# EasyEDA Pro project PROJETO EPTA.epro

# Schematic Schematic1
Board Name: Board1; Create Date: 2026-10-14; Page Name: P1; Project Name: PROJETO EPTA; Schematic Name: Schematic1; Update Date: 2026-10-14; Company: EasyEDA.com; Page Size: A4; Version: V1.0
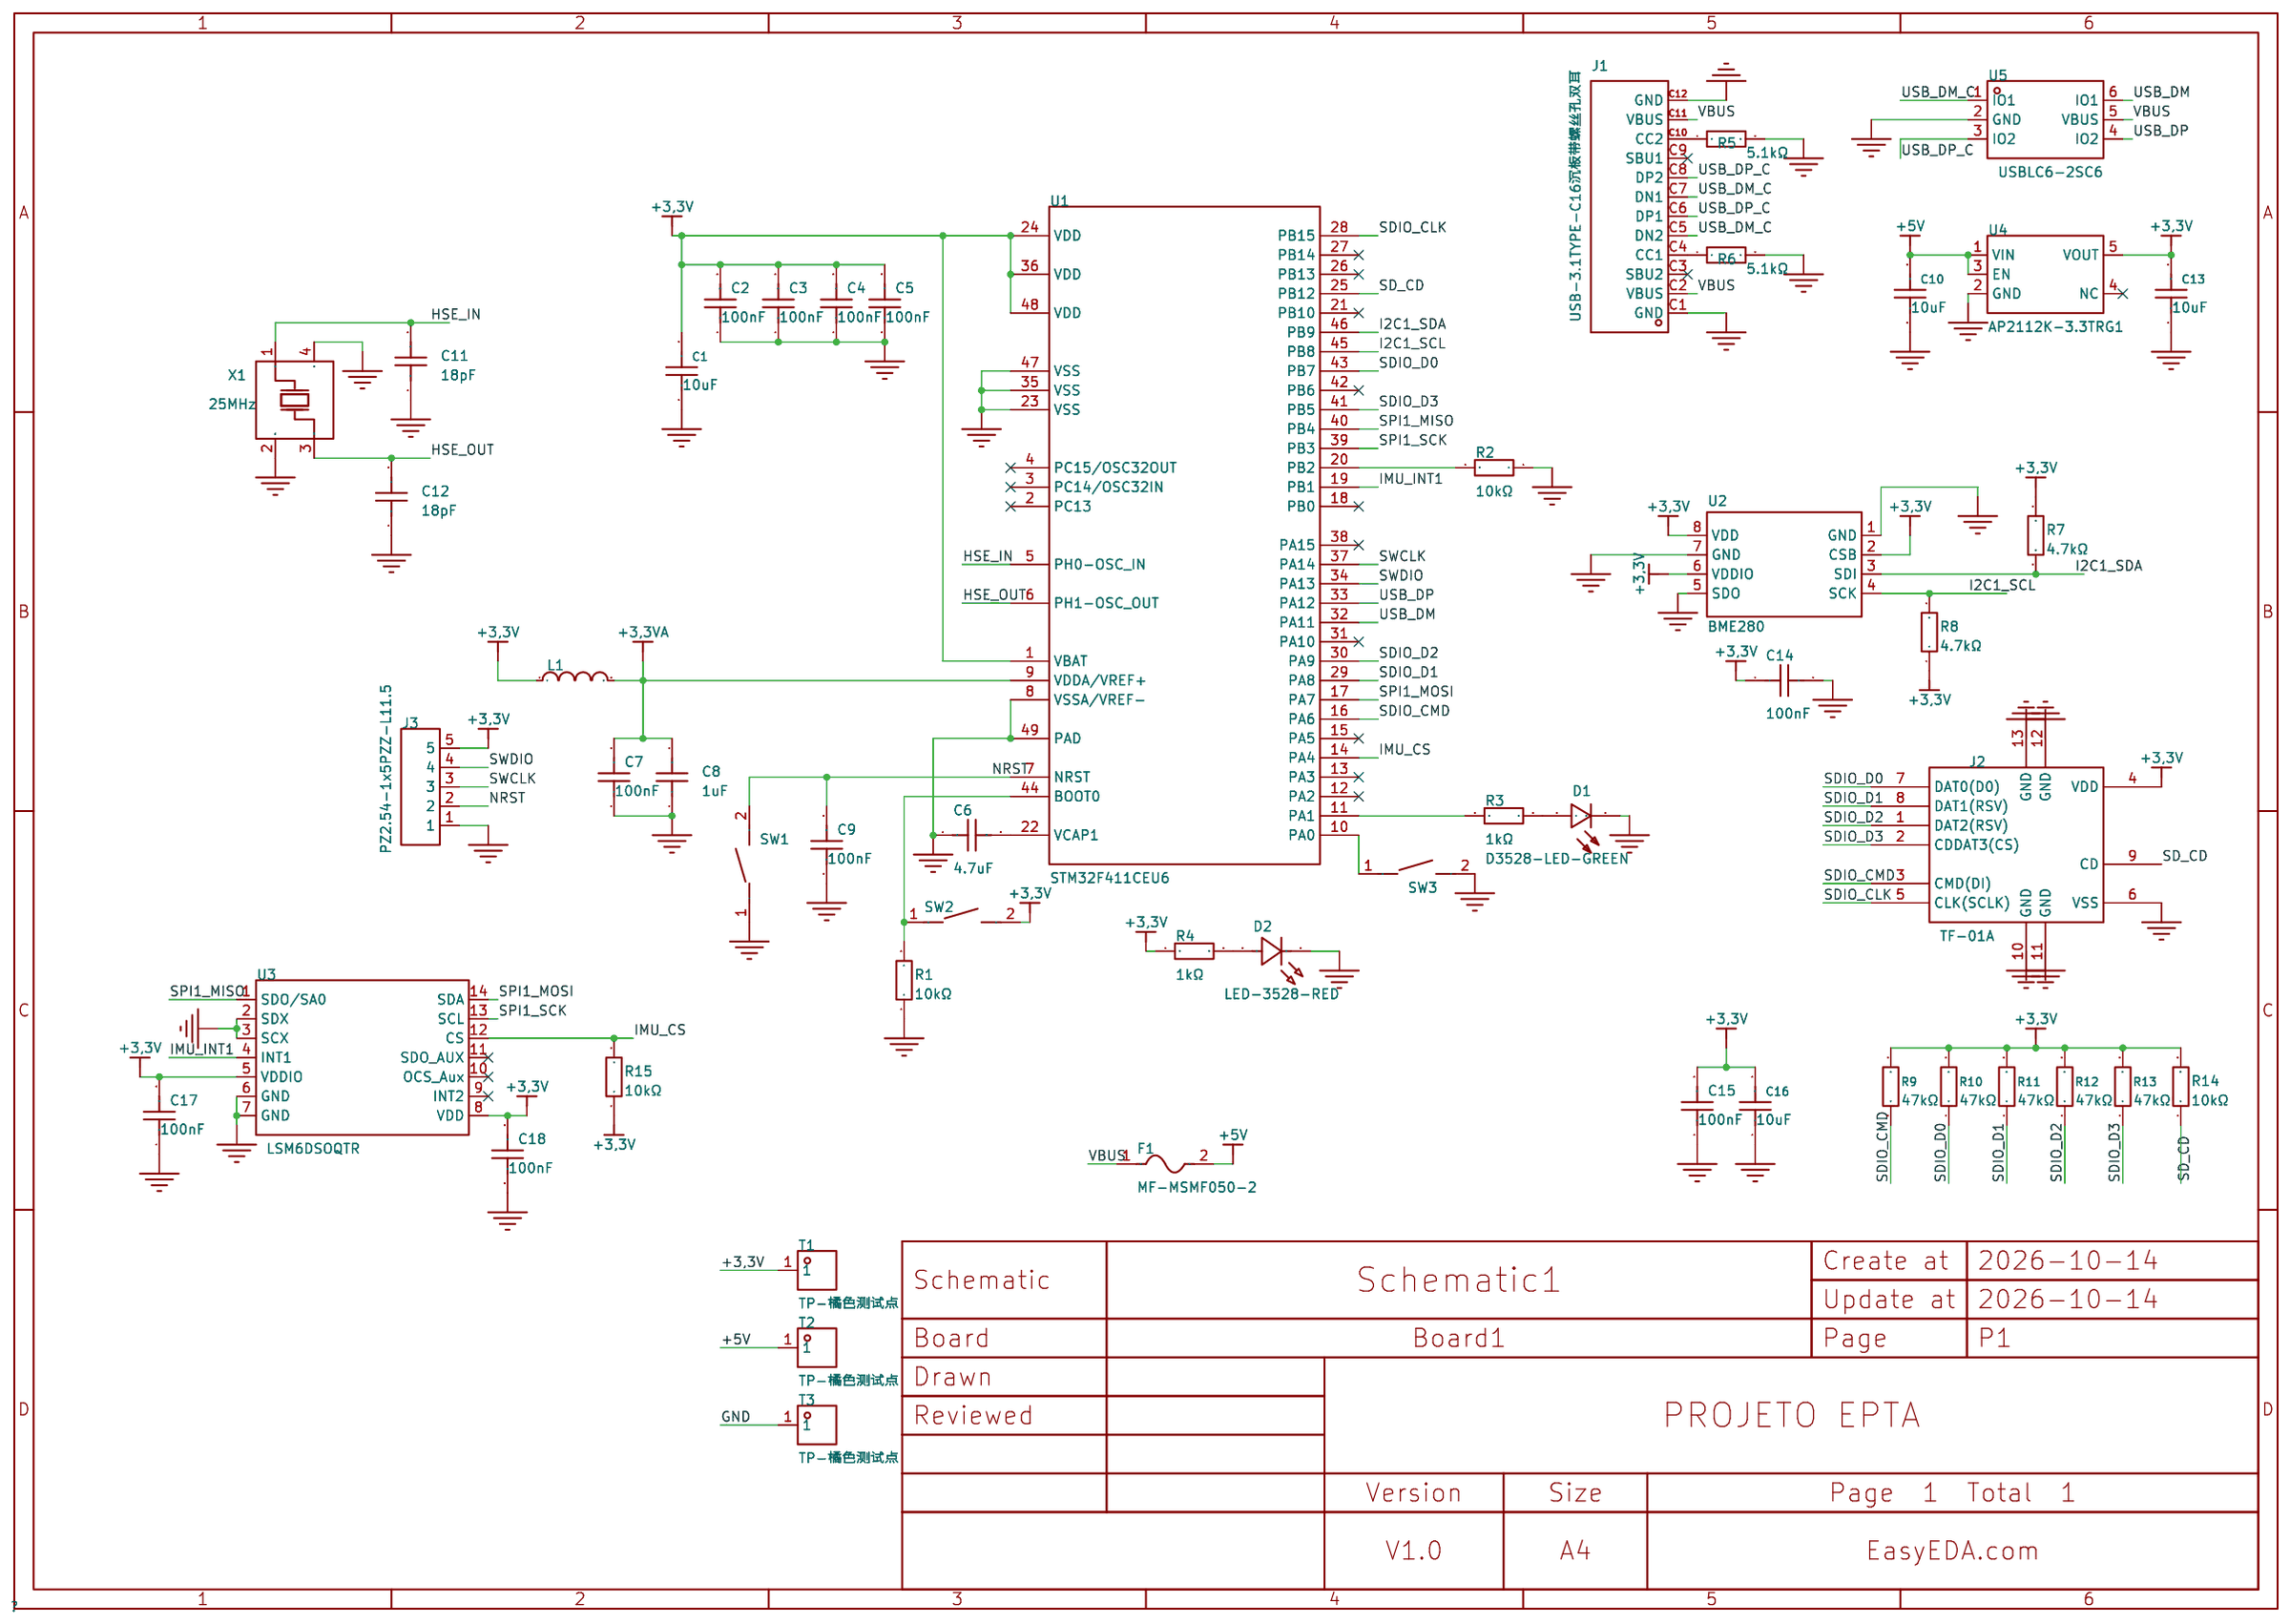
[diagram p0: schematic sheet]

## Parts
C1  10uF  [C0603]
C2  100nF  [C0201]
C3  100nF  [C0201]
C4  100nF  [C0201]
C5  100nF  [C0201]
C6  4.7uF  [C0603]
C7  100nF  [C0201]
C8  1uF  [C0603]
C9  100nF  [C0201]
C10  10uF  [C0603]
C11  18pF  [C0201]
C12  18pF  [C0201]
C13  10uF  [C0603]
C14  100nF  [C0201]
C15  100nF  [C0201]
C16  10uF  [C0603]
C17  100nF  [C0201]
C18  100nF  [C0201]
D1  D3528-LED-GREEN  [LED-SMD_L3.5-W2.8-RD_GREEN]
D2  LED-3528-RED  [LED-SMD_L3.5-W2.8-FD_RED]
F1  MF-MSMF050-2  [F1812]
J1  USB-3.1TYPE-C16沉板带螺丝孔双耳  [USB-C-SMD_USB-3.1TYPE-C16]
J2  TF-01A  [TF-SMD_TF-01A]
J3  PZ2.54-1x5PZZ-L11.5  [HDR-TH_PZ2.54-1X5PZZ-L11.5]
L1  BEAD0402A102A02T  [L0402]
R1  10kΩ  [R0603]
R2  10kΩ  [R0603]
R3  1kΩ  [R0603]
R4  1kΩ  [R0603]
R5  5.1kΩ  [R0603]
R6  5.1kΩ  [R0603]
R7  4.7kΩ  [R0603]
R8  4.7kΩ  [R0603]
R9  47kΩ  [R0603]
R10  47kΩ  [R0603]
R11  47kΩ  [R0603]
R12  47kΩ  [R0603]
R13  47kΩ  [R0603]
R14  10kΩ  [R0603]
R15  10kΩ  [R0603]
SW1  TS-1088-AR02016  [SW-SMD_L3.9-W3.0-P4.45]
SW2  TS-1088-AR02016  [SW-SMD_L3.9-W3.0-P4.45]
SW3  TS-1088-AR02016  [SW-SMD_L3.9-W3.0-P4.45]
T1  TP-橘色测试点  [TESTPOINT-TH_BD3.2]
T2  TP-橘色测试点  [TESTPOINT-TH_BD3.2]
T3  TP-橘色测试点  [TESTPOINT-TH_BD3.2]
U1  STM32F411CEU6  [UFQFPN-48_L7.0-W7.0-P0.50-BL-EP]
U2  BME280  [LGA-8_BME280_BL]
U3  LSM6DSOQTR  [LGA-14_L3.0-W2.5-P0.50-BL]
U4  AP2112K-3.3TRG1  [SOT-23-5_L2.9-W1.6-P0.95-LS2.8-BR]
U5  USBLC6-2SC6  [SOT-23-6_L2.9-W1.6-P0.95-LS2.8-BL]
X1  25MHz  [CRYSTAL-SMD_4P-L3.2-W2.5-BL]

## Library data of the parts
C1 C10 C13 C16 = CL10A106MA8NRNC: Capacitance:10uF Tolerance:±20% Tolerance:±20% Voltage Rating:25V Temperature Coefficient:X5R; LCSC Part Name: 10uF ±20% 25V; Supplier Part: C96446; Manufacturer: SAMSUNG(三星); Supplier Footprint: 0603; JLCPCB Part Class: Basic Part; Datasheet: https://item.szlcsc.com/datasheet/CL10A106MA8NRNC/97651.html; Supplier: LCSC; Tolerance: ±20%; Voltage Rating: 25V; Temperature Coefficient: X5R
C2-C5 C7 C9 C14 C15 C17 C18 = C0603X5R1E104KT00NN: Capacitance:100nF Tolerance:±10% Tolerance:±10% Voltage Rating:25V Temperature Coefficient:X5R; LCSC Part Name: 100nF ±10% 25V; Supplier Part: C694146; Manufacturer: TDK; Supplier Footprint: 0201; JLCPCB Part Class: Extended Part; Datasheet: https://atta.szlcsc.com/upload/public/pdf/source/20191008/C432930_1569A900251E35B50161EFC1E9A1C511.pdf; Supplier: LCSC; Tolerance: ±10%; Voltage Rating: 25V; Temperature Coefficient: X5R
C6 = CL10A475KO8NNNC: Capacitance:4.7uF Tolerance:±10% Tolerance:±10% Voltage Rating:16V Temperature Coefficient:X5R; LCSC Part Name: 4.7uF ±10% 16V; Supplier Part: C19666; Manufacturer: SAMSUNG(三星); Supplier Footprint: 0603; JLCPCB Part Class: Basic Part; Datasheet: https://item.szlcsc.com/datasheet/CL10A475KO8NNNC/20375.html; Supplier: LCSC; Tolerance: ±10%; Voltage Rating: 16V; Temperature Coefficient: X5R
C8 = CL10A105KB8NNNC: Capacitance:1uF Tolerance:±10% Tolerance:±10% Voltage Rating:50V Temperature Coefficient:X5R; LCSC Part Name: 1uF ±10% 50V; Supplier Part: C15849; Manufacturer: SAMSUNG(三星); Supplier Footprint: 0603; JLCPCB Part Class: Basic Part; Datasheet: https://item.szlcsc.com/datasheet/CL10A105KB8NNNC/16531.html; Supplier: LCSC; Tolerance: ±10%; Voltage Rating: 50V; Temperature Coefficient: X5R
C11 C12 = V180K0201C0G500NAT: Capacitance:18pF Tolerance:±10% Tolerance:±10% Voltage Rating:50V Temperature Coefficient:C0G; LCSC Part Name: 18pF ±10% 50V; Supplier Part: C525071; Manufacturer: VIIYONG(微容); Supplier Footprint: 0201; JLCPCB Part Class: Extended Part; Datasheet: https://atta.szlcsc.com/upload/public/pdf/source/20200508/C525085_CA83688404A026D90E3292C67F2EEEA3.pdf; Supplier: LCSC; Tolerance: ±10%; Voltage Rating: 50V; Temperature Coefficient: C0G
D1 = D3528-LED-GREEN: Supplier Part: C9900001516; Supplier Footprint: LED-GREEN; JLCPCB Part Class: Extended Part; Supplier: LCSC
D2 = LED-3528-RED: Supplier Part: C9900020242; JLCPCB Part Class: Extended Part; Supplier: LCSC
F1 = MF-MSMF050-2: Voltage - Max:15V Current - Max:100A Hold Current:500mA Trip Current:1A Power Dissipation:800mW Resistance - Initial (Ri) (Min):150mΩ Resistance - Post Trip (R1) (Max):1Ω Time to Trip(Max):150ms Operating Temperature:-40℃~+85℃ Operating Temperature:-40℃~+; LCSC Part Name: 15V 500mA 1812自恢复; Supplier Part: C17313; Manufacturer: BOURNS; Supplier Footprint: 1812; JLCPCB Part Class: Extended Part; Datasheet: https://item.szlcsc.com/datasheet/MF-MSMF050-2/17998.html; Supplier: LCSC; Voltage - Max: 15V; Current - Max: 100A; Hold Current: 500mA; Trip Current: 1A; Power Dissipation: 800mW; Resistance - Initial (Ri) (Min): 150mΩ; Resistance - Post Trip (R1) (Max): 1Ω; Time to Trip(Max): 150ms; Operating Temperature: -40℃~+85℃; Length: 5.4mm; Width: 3.2mm; Height: 0.85mm
J1 = USB-3.1TYPE-C16沉板带螺丝孔双耳: Supplier Part: C9900026744; Supplier Footprint: USB-C-16P; JLCPCB Part Class: Extended Part; Supplier: LCSC
J2 = TF-01A: Supplier Part: C9900015511; Supplier Footprint: tf-smd; JLCPCB Part Class: Extended Part; Supplier: LCSC
J3 = PZ2.54-1x5PZZ-L11.5: Pin Structure:1x5P Pitch:2.54mm Row Spacing:- Circluar Pins/Square Pins:Pin Header Mounting Type:Through Hole Number of Rows:1 Number of Pins:5P Current Rating:3A Voltage Rating (Max):250V Length of Mating Pin:6mm Insulation Height:2.5mm Length of End Con; LCSC Part Name: 1x5P 间距:2.54mm 方针 直插; Supplier Part: C54876670; Manufacturer: SHOU HAN(首韩); Supplier Footprint: 插件,P=2.54mm; JLCPCB Part Class: Extended Part; Datasheet: https://item.szlcsc.com/datasheet/PZ2.54-1x5PZZ-L11.5/58389785.html; Supplier: LCSC; Pin Structure: 1x5P; Pitch: 2.54mm; Circluar Pins/Square Pins: Pin Header; Mounting Type: Through Hole; Number of Rows: 1; Number of Pins: 5P; Current Rating: 3A; Voltage Rating (Max): 250V; Length of Mating Pin: 6mm; Insulation Height: 2.5mm; Length of End Connection Pin: 3mm; Contact Material: Brass; Contact Plating: Gold; Operating Temperature: -40℃~+105℃; Color: Black
L1 = BEAD0402A102A02T: Supplier Part: C9900021104; JLCPCB Part Class: Extended Part; Supplier: LCSC
R1 R2 R14 R15 = 0603WAF1002T5E: Type:Thick Film Resistor Resistance:10kΩ Tolerance:±1% Tolerance:±1% Power(Watts):100mW Voltage-Supply(Max):75V Temperature Coefficient:±100ppm/℃ Temperature Coefficient:±100ppm/℃ Operating Temperature:-55℃~+155℃ Operating Temperature:-55℃~+155℃; LCSC Part Name: 厚膜电阻 10kΩ ±1% 100mW; Supplier Part: C25804; Manufacturer: UNI-ROYAL(厚声); Supplier Footprint: 0603; JLCPCB Part Class: Basic Part; Datasheet: https://item.szlcsc.com/datasheet/0603WAF1002T5E/26547.html; Supplier: LCSC; Type: Thick Film Resistor; Tolerance: ±1%; Power(Watts): 100mW; Voltage-Supply(Max): 75V; Temperature Coefficient: ±100ppm/℃; Operating Temperature: -55℃~+155℃
R3 R4 = 0603WAF1001T5E: Type:Thick Film Resistor Resistance:1kΩ Tolerance:±1% Tolerance:±1% Power(Watts):100mW Voltage-Supply(Max):75V Temperature Coefficient:±100ppm/℃ Temperature Coefficient:±100ppm/℃ Operating Temperature:-55℃~+155℃ Operating Temperature:-55℃~+155℃; LCSC Part Name: 1kΩ ±1% 100mW 厚膜电阻; Supplier Part: C21190; Manufacturer: UNI-ROYAL(厚声); Supplier Footprint: 0603; JLCPCB Part Class: Basic Part; Datasheet: https://item.szlcsc.com/datasheet/0603WAF1001T5E/21904.html; Supplier: LCSC; Type: Thick Film Resistor; Tolerance: ±1%; Power(Watts): 100mW; Voltage-Supply(Max): 75V; Temperature Coefficient: ±100ppm/℃; Operating Temperature: -55℃~+155℃
R5 R6 = 0603WAF5101T5E: Type:Thick Film Resistor Resistance:5.1kΩ Tolerance:±1% Tolerance:±1% Power(Watts):100mW Voltage-Supply(Max):75V Temperature Coefficient:±100ppm/℃ Temperature Coefficient:±100ppm/℃ Operating Temperature:-55℃~+155℃ Operating Temperature:-55℃~+155℃; LCSC Part Name: 厚膜电阻 5.1kΩ ±1%; Supplier Part: C23186; Manufacturer: UNI-ROYAL(厚声); Supplier Footprint: 0603; JLCPCB Part Class: Basic Part; Datasheet: https://item.szlcsc.com/datasheet/0603WAF5101T5E/23913.html; Supplier: LCSC; Type: Thick Film Resistor; Tolerance: ±1%; Power(Watts): 100mW; Voltage-Supply(Max): 75V; Temperature Coefficient: ±100ppm/℃; Operating Temperature: -55℃~+155℃
R7 R8 = 0603WAF4701T5E: Type:Thick Film Resistor Resistance:4.7kΩ Tolerance:±1% Tolerance:±1% Power(Watts):100mW Voltage-Supply(Max):75V Temperature Coefficient:±100ppm/℃ Temperature Coefficient:±100ppm/℃ Operating Temperature:-55℃~+155℃ Operating Temperature:-55℃~+155℃; LCSC Part Name: 厚膜电阻 4.7kΩ ±1%; Supplier Part: C23162; Manufacturer: UNI-ROYAL(厚声); Supplier Footprint: 0603; JLCPCB Part Class: Basic Part; Datasheet: https://item.szlcsc.com/datasheet/0603WAF4701T5E/23889.html; Supplier: LCSC; Type: Thick Film Resistor; Tolerance: ±1%; Power(Watts): 100mW; Voltage-Supply(Max): 75V; Temperature Coefficient: ±100ppm/℃; Operating Temperature: -55℃~+155℃
R9-R13 = 0603WAF4702T5E: Type:Thick Film Resistor Resistance:47kΩ Tolerance:±1% Tolerance:±1% Power(Watts):100mW Voltage-Supply(Max):75V Temperature Coefficient:±100ppm/℃ Temperature Coefficient:±100ppm/℃ Operating Temperature:-55℃~+155℃ Operating Temperature:-55℃~+155℃; LCSC Part Name: 厚膜电阻 47kΩ ±1%; Supplier Part: C25819; Manufacturer: UNI-ROYAL(厚声); Supplier Footprint: 0603; JLCPCB Part Class: Basic Part; Datasheet: https://item.szlcsc.com/datasheet/0603WAF4702T5E/26562.html; Supplier: LCSC; Type: Thick Film Resistor; Tolerance: ±1%; Power(Watts): 100mW; Voltage-Supply(Max): 75V; Temperature Coefficient: ±100ppm/℃; Operating Temperature: -55℃~+155℃
SW1-SW3 = TS-1088-AR02016: Circuit:SPST Actuator Style:Round Button Operating Force:1.6N Mounting Type:Surface Mount,Vertical Length:3.9mm Width:3mm Switch Height:2mm with Bracket:Without Bracket Contact Current:50mA Voltage Rating:12V Actuator/Cap Color:Black With Lamp:- IP Rating; LCSC Part Name: 3.9*3*2mm 立贴 轻触开关; Supplier Part: C720477; Manufacturer: XUNPU(讯普); Supplier Footprint: SMD,4x3mm; JLCPCB Part Class: Basic Part; Datasheet: https://item.szlcsc.com/datasheet/TS-1088-AR02016/763484.html; Supplier: LCSC; Circuit: SPST; Actuator Style: Round Button; Operating Force: 1.6N; Mounting Type: Surface Mount,Vertical; Length: 3.9mm; Width: 3mm; Switch Height: 2mm; with Bracket: Without Bracket; Contact Current: 50mA; Voltage Rating: 12V; Actuator/Cap Color: Black; Termination Style: SMD(SMT) Tab; Life: 100,000 cycles; Operating Temperature: -30℃~+80℃
T1-T3 = TP-橘色测试点: Supplier Part: C9900007421; Supplier Footprint: TESTPOINT-TH_BD-2P-P2.00; JLCPCB Part Class: Extended Part; Supplier: LCSC
U1 = STM32F411CEU6: CPU Core:ARM Cortex-M4 CPU Maximum Speed:100MHz Core Size:32 Bit Program Storage Size:512KB Program Memory Type:FLASH RAM Size:128KB EEPROM:- Number of I/O:36 ADC (Bit):12bit Oscillator Type:Built-in Voltage - Supply:1.7V~3.6V Voltage - Supply:1.7V~3.6V O; LCSC Part Name: 带DSP和FPU的高性能基本型系列ARM Cortex-M4 MCU，具有512 KB Flash、100 MHz CPU和ART加速器; Supplier Part: C60420; Manufacturer: ST(意法半导体); Supplier Footprint: UFQFPN-48(7x7); JLCPCB Part Class: Extended Part; Datasheet: https://item.szlcsc.com/datasheet/STM32F411CEU6/61472.html; Supplier: LCSC; CPU Core: ARM Cortex-M4; CPU Maximum Speed: 100MHz; Core Size: 32 Bit; Program Storage Size: 512KB; Program Memory Type: FLASH; RAM Size: 128KB; Number of I/O: 36; ADC (Bit): 12bit; Oscillator Type: Built-in; Voltage - Supply: 1.7V~3.6V; Operating Temperature: -40℃~+85℃
U2 = BME280: Temperature Range:-40℃~+85℃ Temperature Range:-40℃~+85℃ Humidity:0%RH~100%RH Humidity:0%RH~100%RH Interface:I2C；SPI Voltage - Supply:1.71V~3.6V Voltage - Supply:1.71V~3.6V Current - Supply:1.8uA Humidity Tolerance:±3%RH Humidity Tolerance:±3%RH Temperatur; LCSC Part Name: 湿度：0%RH~100%RH; Supplier Part: C92489; Manufacturer: Bosch(博世); Supplier Footprint: LGA-8(2.5x2.5); JLCPCB Part Class: Extended Part; Datasheet: https://item.szlcsc.com/datasheet/BME280/93682.html; Supplier: LCSC; Temperature Range: -40℃~+85℃; Humidity: 0%RH~100%RH; Interface: I2C；SPI; Voltage - Supply: 1.71V~3.6V; Current - Supply: 1.8uA; Humidity Tolerance: ±3%RH; Temperature Tolerance: ±0.5℃; Resolution: 16bit; Features: Self-diagnosis and confidence flag；Temperature compensation；Factory calibration
U3 = LSM6DSOQTR: Accelerometer Sensing Axis:X,Y,Z Acceleration Measurement Range (MAX):±16g Acceleration Measurement Range (MAX):±16g Gyroscope Sensing Axis:X,Y,Z Gyroscope Measurement Range (MAX):±2000dps Gyroscope Measurement Range (MAX):±2000dps Sensor Type:IMU (accele; LCSC Part Name: 六轴惯性测量单元（IMU）：常开式三轴加速度计和三轴陀螺仪; Supplier Part: C6805512; Manufacturer: ST(意法半导体); Supplier Footprint: LGA-14L(2.5x3); JLCPCB Part Class: Extended Part; Datasheet: https://item.szlcsc.com/datasheet/LSM6DSOQTR/7766212.html; Supplier: LCSC; Accelerometer Sensing Axis: X,Y,Z; Acceleration Measurement Range (MAX): ±16g; Gyroscope Sensing Axis: X,Y,Z; Gyroscope Measurement Range (MAX): ±2000dps; Sensor Type: IMU (accelerometer + gyroscope); Interface: I2C；SPI; Voltage - Supply: 1.71V~3.6V; Cache Size: 9KB; Standby Current: 3uA; Operating Temperature: -40℃~+85℃; Features: Motion event detection
U4 = AP2112K-3.3TRG1_C23380830: Output Configuration:Positive Voltage - Supply:5.5V Output Voltage:3.3V Output Voltage:3.3V Output Current:600mA Power Supply Rejection Ratio (PSRR):75dB@(1kHz) Voltage Dropout:320mV@(600mA) standby current:10uA Noise:- Features:Enable control；Over Curren; LCSC Part Name: 3.3V 600mA 5.5V; Supplier Part: C23380830; Manufacturer: TECH PUBLIC(台舟); Supplier Footprint: SOT-23-5; JLCPCB Part Class: Extended Part; Datasheet: https://item.szlcsc.com/datasheet/AP2112K-3.3TRG1/25111500.html; Supplier: LCSC; Output Configuration: Positive; Voltage - Supply: 5.5V; Output Voltage: 3.3V; Output Current: 600mA; Power Supply Rejection Ratio (PSRR): 75dB@(1kHz); Voltage Dropout: 320mV@(600mA); standby current: 10uA; Features: Enable control；Over Current Protection；Output discharge；Thermal shutdown; Operating Temperature: -40℃~+85℃@(Ta); Output Type: Fixed; Number of Outputs: 1
U5 = USBLC6-2SC6_C2827654: Polarity:Unidirectional Reverse Stand-Off Voltage (Vrwm):5V Clamping Voltage:12V Peak Pulse Current (Ipp):6A Peak Pulse Power Dissipation (Ppp):150W Voltage - Breakdown:6V Reverse Leakage Current (Ir):80nA Number of Channels:2 Operating Temperature:-55℃~+; LCSC Part Name: 单向ESD 5V截止 峰值脉冲电流：6A; Supplier Part: C2827654; Manufacturer: TECH PUBLIC(台舟); Supplier Footprint: SOT-23-6; JLCPCB Part Class: Extended Part; Datasheet: https://item.szlcsc.com/datasheet/USBLC6-2SC6/2973336.html; Supplier: LCSC; Polarity: Unidirectional; Reverse Stand-Off Voltage (Vrwm): 5V; Clamping Voltage: 12V; Peak Pulse Current (Ipp): 6A; Peak Pulse Power Dissipation (Ppp): 150W; Voltage - Breakdown: 6V; Reverse Leakage Current (Ir): 80nA; Number of Channels: 2; Operating Temperature: -55℃~+125℃; level of protection: IEC 61000-4-2；IEC 61000-4-4；IEC 61000-4-5; Type: ESD; Junction Capacitance: 0.35pF
X1 = X322525MOB4SI: Type:Crystal Oscillator Frequency:25MHz Normal temperature Frequency Tolerance:±10ppm Normal temperature Frequency Tolerance:±10ppm Load Capacitance:12pF Frequency Stability:±20ppm Frequency Stability:±20ppm Equivalent Series Resistance(ESR):50Ω Operating; LCSC Part Name: YSX321SL 25MHZ 4P 3225 12PF ±10PPM -40~85℃ (±20PPM); Supplier Part: C9006; Manufacturer: YXC(扬兴晶振); Supplier Footprint: SMD3225-4P; JLCPCB Part Class: Basic Part; Datasheet: https://item.szlcsc.com/datasheet/X322525MOB4SI/9526.html; Supplier: LCSC; Type: Crystal Oscillator; Normal temperature Frequency Tolerance: ±10ppm; Load Capacitance: 12pF; Frequency Stability: ±20ppm; Equivalent Series Resistance(ESR): 50Ω; Operating Temperature: -40℃~+85℃

## Nets
+5V: C10.2 F1.2 T2.1 U4.1(VIN) U4.3(EN)
GND: C1.1 C2.1 C3.1 C4.1 C5.1 C6.1 C7.1 C8.1 C9.1 C10.1 C11.1 C12.1 C13.1 C14.2 C15.1 C16.1 C17.1 C18.1 D1.1(K) D2.1 J1.C1(GND) J1.C12(GND) J2.6(VSS) J2.10(GND) J2.11(GND) J2.12(GND) J2.13(GND) J3.1 R1.1 R2.1 R5.2 R6.2 SW1.1 SW3.2 T3.1 U1.8(VSSA/VREF-) U1.23(VSS) U1.35(VSS) U1.47(VSS) U1.49(PAD) U2.1(GND) U2.5(SDO) U2.7(GND) U3.2(SDX) U3.3(SCX) U3.6(GND) U3.7(GND) U4.2(GND) U5.2(GND) X1.2(GND) X1.4(GND)
VBUS: F1.1 J1.C2(VBUS) J1.C11(VBUS) U5.5(VBUS)
+3,3V: C1.2 C2.2 C3.2 C4.2 C5.2 C13.2 C14.1 C15.2 C16.2 C17.2 C18.2 J2.4(VDD) J3.5 L1.1 R4.1 R7.2 R8.1 R9.2 R10.2 R11.2 R12.2 R13.2 R14.2 R15.1 SW2.2 T1.1 U1.1(VBAT) U1.24(VDD) U1.36(VDD) U1.48(VDD) U2.2(CSB) U2.6(VDDIO) U2.8(VDD) U3.5(VDDIO) U3.8(VDD) U4.5(VOUT)
+3,3VA: C7.2 C8.2 L1.2 U1.9(VDDA/VREF+)
HSE_IN: C11.2 U1.5(PH0-OSC_IN) X1.1(OSC1)
HSE_OUT: C12.2 U1.6(PH1-OSC_OUT) X1.3(OSC2)
I2C1_SCL: R8.2 U1.45(PB8) U2.4(SCK)
I2C1_SDA: R7.1 U1.46(PB9) U2.3(SDI)
IMU_CS: R15.2 U1.14(PA4) U3.12(CS)
IMU_INT1: U1.19(PB1) U3.4(INT1)
NRST: C9.2 J3.2 SW1.2 U1.7(NRST)
SD_CD: J2.9(CD) R14.1 U1.25(PB12)
SDIO_CLK: J2.5(CLK(SCLK)) U1.28(PB15)
SDIO_CMD: J2.3(CMD(DI)) R9.1 U1.16(PA6)
SDIO_D0: J2.7(DAT0(D0)) R10.1 U1.43(PB7)
SDIO_D1: J2.8(DAT1(RSV)) R11.1 U1.29(PA8)
SDIO_D2: J2.1(DAT2(RSV)) R12.1 U1.30(PA9)
SDIO_D3: J2.2(CDDAT3(CS)) R13.1 U1.41(PB5)
SPI1_MISO: U1.40(PB4) U3.1(SDO/SA0)
SPI1_MOSI: U1.17(PA7) U3.14(SDA)
SPI1_SCK: U1.39(PB3) U3.13(SCL)
SWCLK: J3.3 U1.37(PA14)
SWDIO: J3.4 U1.34(PA13)
USB_DM: U1.32(PA11) U5.6(IO1)
USB_DM_C: J1.C5(DN2) J1.C7(DN1) U5.1(IO1)
USB_DP: U1.33(PA12) U5.4(IO2)
USB_DP_C: J1.C6(DP1) J1.C8(DP2) U5.3(IO2)
$1N12: C6.2 U1.22(VCAP1)
$1N43: R1.2 SW2.1 U1.44(BOOT0)
$1N49: R2.2 U1.20(PB2)
$1N78: R3.1 U1.11(PA1)
$1N80: SW3.1 U1.10(PA0)
$1N256: D1.2(A) R3.2
$1N258: D2.2 R4.2
$1N260: J1.C10(CC2) R5.1
$1N261: J1.C4(CC1) R6.1

Not connected (* = marked no-connect by the designer): J1 C3(SBU2)* C9(SBU1)*; U1 2(PC13)* 3(PC14/OSC32IN)* 4(PC15/OSC32OUT)* 12(PA2)* 13(PA3)* 15(PA5)* 18(PB0)* 21(PB10)* 26(PB13)* 27(PB14)* 31(PA10)* 38(PA15)* 42(PB6)*; U3 9(INT2)* 10(OCS_Aux)* 11(SDO_AUX)*; U4 4(NC)*

# Board PCB1
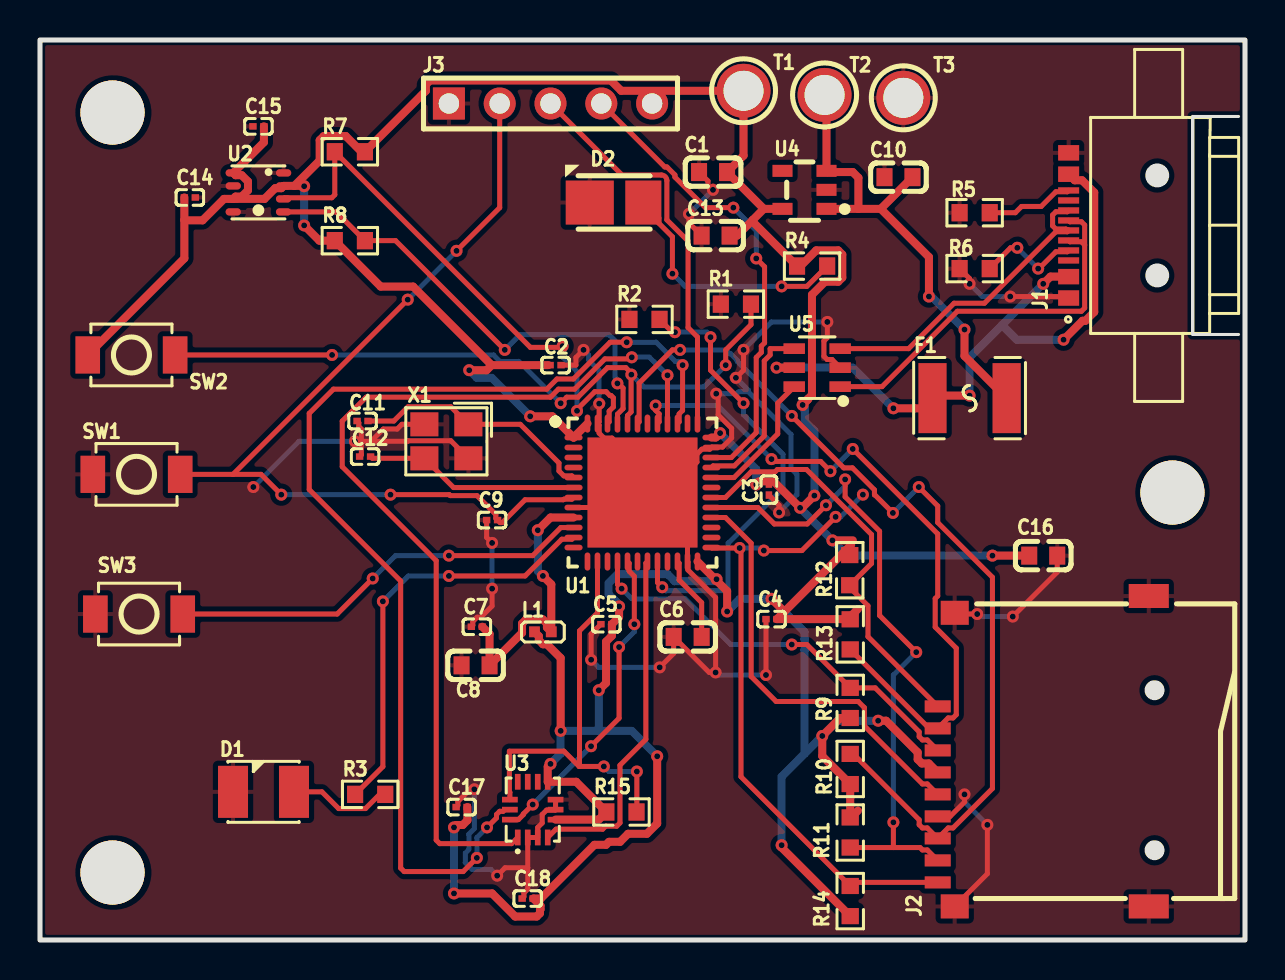
[diagram p1: board, top side]
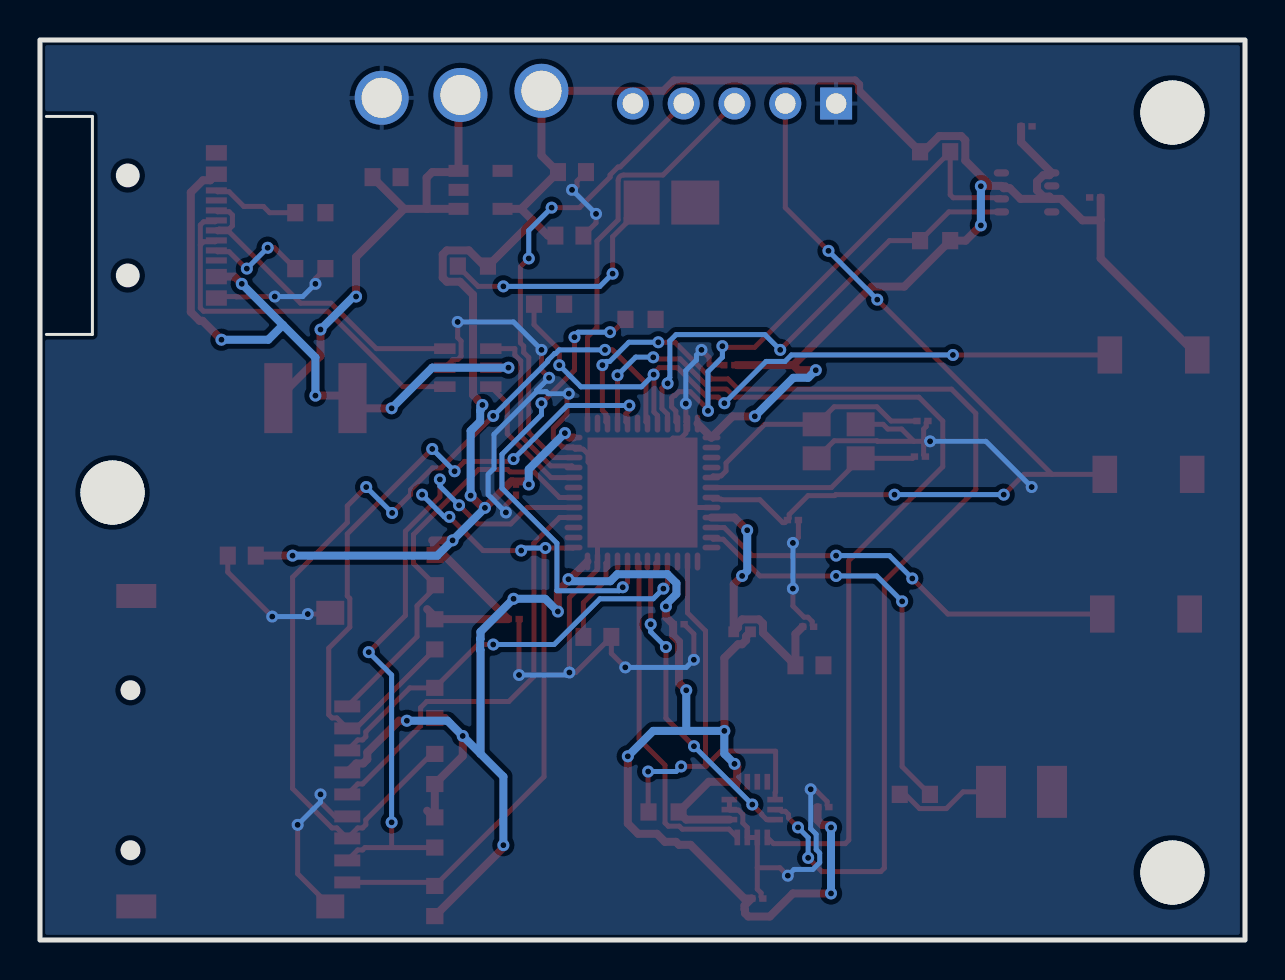
[diagram p2: board, bottom side, seen from below]

Outline 60.25 x 45 mm; copper layers: Top Layer, Bottom Layer. Coordinates in mm from the lower left corner of the outline.
Outline path: rectangle 0,45 60.25,0
Stack: Top Layer 0.035mm / Dielectric1 1.51mm FR4 er 4.5 / Bottom Layer 0.035mm

## Design rules (mm)
spacing copperThickness1oz (default): track to track 0.152, other pairs 0.152 to 0.3
spacing copperThickness2oz: track to track 0.203, other pairs 0.152 to 0.3
track width copperThickness1oz (default): min 0.15, default 0.25, max 2.54
track width copperThickness2oz: min 0.203, default 0.254, max 2.54
differential pair differentialPair (default): width min 0.127, default 0.254, max 2.54; gap min 0.152, default 0.152
net GND uses copperRegion

## Placement (name value [footprint] x y rotation side)
C1  10uF  [C0603]  33.65 38.4 0 top
C2  100nF  [C0201]  25.78 28.74 180 top
C3  100nF  [C0201]  36.45 22.52 90 top
C4  100nF  [C0201]  36.58 16.04 0 top
C5  100nF  [C0201]  28.32 15.79 0 top
C6  4.7uF  [C0603]  32.39 15.16 0 top
C7  100nF  [C0201]  21.84 15.66 0 top
C8  1uF  [C0603]  21.78 13.73 0 top
C9  100nF  [C0201]  22.61 21 0 top
C10  10uF  [C0603]  42.93 38.14 0 top
C11  18pF  [C0201]  16.13 25.95 0 top
C12  18pF  [C0201]  16.26 24.17 0 top
C13  10uF  [C0603]  33.78 35.22 0 top
C14  100nF  [C0201]  7.49 37.13 0 top
C15  100nF  [C0201]  10.92 40.68 0 top
C16  10uF  [C0603]  50.17 19.22 180 top
C17  100nF  [C0201]  21.08 6.65 0 top
C18  100nF  [C0201]  24.38 2.07 0 top
D1  D3528-LED-GREEN  [LED-SMD_L3.5-W2.8-RD_GREEN]  11.18 7.41 0 top
D2  LED-3528-RED  [LED-SMD_L3.5-W2.8-FD_RED]  28.83 36.87 0 top
F1  MF-MSMF050-2  [F1812]  46.48 27.09 0 top
J1  USB-3.1TYPE-C16沉板带螺丝孔双耳  [USB-C-SMD_USB-3.1TYPE-C16]  51.43 35.73 90 top
J2  TF-01A  [TF-SMD_TF-01A]  50.17 9.44 90 top
J3  PZ2.54-1x5PZZ-L11.5  [HDR-TH_PZ2.54-1X5PZZ-L11.5]  25.53 41.83 0 top
L1  BEAD0402A102A02T  [L0402]  25.15 15.41 0 top
NOREF  -  [Pad_e212]  3.63 3.37 0 top
NOREF#2  -  [Pad_e891]  56.63 22.37 0 top
NOREF#3  -  [Pad_e211]  3.63 41.37 0 top
R1  10kΩ  [R0603]  34.8 31.79 0 top
R2  10kΩ  [R0603]  30.23 31.03 0 top
R3  1kΩ  [R0603]  16.51 7.28 0 top
R4  1kΩ  [R0603]  38.61 33.7 0 top
R5  5.1kΩ  [R0603]  46.74 36.36 180 top
R6  5.1kΩ  [R0603]  46.74 33.57 180 top
R7  4.7kΩ  [R0603]  15.49 39.41 0 top
R8  4.7kΩ  [R0603]  15.49 34.97 0 top
R9  47kΩ  [R0603]  40.51 11.85 270 top
R10  47kΩ  [R0603]  40.51 8.55 270 top
R11  47kΩ  [R0603]  40.51 5.38 90 top
R12  47kΩ  [R0603]  40.49 18.49 90 top
R13  47kΩ  [R0603]  40.51 15.28 90 top
R14  10kΩ  [R0603]  40.51 1.95 270 top
R15  10kΩ  [R0603]  29.07 6.4 0 top
SW1  TS-1088-AR02016  [SW-SMD_L3.9-W3.0-P4.45]  4.83 23.28 0 top
SW2  TS-1088-AR02016  [SW-SMD_L3.9-W3.0-P4.45]  4.57 29.25 180 top
SW3  TS-1088-AR02016  [SW-SMD_L3.9-W3.0-P4.45]  4.95 16.3 180 top
T1  TP-橘色测试点  [TESTPOINT-TH_BD3.2]  35.18 42.46 0 top
T2  TP-橘色测试点  [TESTPOINT-TH_BD3.2]  39.23 42.25 0 top
T3  TP-橘色测试点  [TESTPOINT-TH_BD3.2]  43.17 42.11 0 top
U1  STM32F411CEU6  [UFQFPN-48_L7.0-W7.0-P0.50-BL-EP]  30.13 22.37 270 top
U2  BME280  [LGA-8_BME280_BL]  10.92 37.38 0 top
U3  LSM6DSOQTR  [LGA-14_L3.0-W2.5-P0.50-BL]  24.64 6.52 0 top
U4  AP2112K-3.3TRG1  [SOT-23-5_L2.9-W1.6-P0.95-LS2.8-BR]  38.23 37.51 0 top
U5  USBLC6-2SC6  [SOT-23-6_L2.9-W1.6-P0.95-LS2.8-BL]  38.86 28.62 90 top
X1  25MHz  [CRYSTAL-SMD_4P-L3.2-W2.5-BL]  20.32 24.93 180 top

## Footprints (pads in the part's own frame, mm; a bottom-side part is the same pattern mirrored in y, then rotated)
C0201
  rect 0.368x0.324 smd: 1(-0.275,0) 2(0.275,0)
C0603
  rect 0.8x0.9 smd: 1(-0.7,0) 2(0.7,0)
CRYSTAL-SMD_4P-L3.2-W2.5-BL
  rect 1.4x1.2 smd: 1(-1.1,-0.85) 2(1.1,-0.85) 3(1.1,0.85) 4(-1.1,0.85)
F1812
  rect 1.407x3.499 smd: 1(-1.853,0) 2(1.853,0)
HDR-TH_PZ2.54-1X5PZZ-L11.5
  rect 1.6x1.6 hole 1.02: 1(-5.08,0)
  round 1.6 hole 1.02: 2(-2.54,0) 3(0,0) 4(2.54,0) 5(5.08,0)
L0402
  rect 0.54x0.54 smd: 1(-0.42,0) 2(0.42,0)
LED-SMD_L3.5-W2.8-FD_RED
  rect 2.4x2.2 smd: 1(-1.34,0)
  rect 1.8x2.2 smd: 2(1.34,0)
LED-SMD_L3.5-W2.8-RD_GREEN
  rect 1.5x2.6 smd: 1(-1.524,0) 2(1.524,0)
LGA-8_BME280_BL
  oval 0.767x0.364 smd: 1(1.258,0.975) 2(1.258,0.325) 3(1.258,-0.325) 4(1.258,-0.975) 5(-1.258,-0.975) 6(-1.258,-0.325) 7(-1.258,0.325) 8(-1.258,0.975)
LGA-14_L3.0-W2.5-P0.50-BL
  rect 0.28x0.785 smd: 1(-0.75,-1.393) 2(-0.25,-1.393) 3(0.25,-1.393) 4(0.75,-1.393) 8(0.75,1.393) 9(0.25,1.393) 10(-0.25,1.393) 11(-0.75,1.393)
  rect 0.785x0.28 smd: 5(1.143,-0.5) 6(1.143,0) 7(1.143,0.5) 12(-1.143,0.5) 13(-1.143,0) 14(-1.143,-0.5)
Pad_e211
  round 3.2 hole 3.2: (0,0)
Pad_e212
  round 3.2 hole 3.2: (0,0)
Pad_e891
  round 3.2 hole 3.2: (0,0)
R0603
  rect 0.806x0.864 smd: 1(-0.753,0) 2(0.753,0)
SOT-23-5_L2.9-W1.6-P0.95-LS2.8-BR
  rect 1x0.6 smd: 1(1.1,-0.95) 2(1.1,0) 3(1.1,0.95) 4(-1.1,0.95) 5(-1.1,-0.95)
SOT-23-6_L2.9-W1.6-P0.95-LS2.8-BL
  rect 0.532x1.072 smd: 1(-0.95,-1.149) 2(0,-1.149) 3(0.95,-1.149) 4(0.95,1.149) 5(0,1.149) 6(-0.95,1.149)
SW-SMD_L3.9-W3.0-P4.45
  rect 1.23x1.86 smd: 1(-2.185,0) 2(2.185,0)
TESTPOINT-TH_BD3.2
  round 2.7 hole 2: 1(0,0)
TF-SMD_TF-01A
  rect 0.6x1.3 smd: 1(2.24,5.276) 2(1.14,5.276) 3(0.04,5.276) 4(-1.06,5.276) 5(-2.16,5.276) 6(-3.26,5.276) 7(-4.36,5.276) 8(-5.46,5.276) 9(-6.56,5.276)
  rect 1.2x1.4 smd: 10(-7.76,4.426) 13(6.92,4.426)
  rect 1.2x2 smd: 11(-7.76,-5.276) 12(7.76,-5.276)
UFQFPN-48_L7.0-W7.0-P0.50-BL-EP
  oval 0.28x0.9 smd: 1(-2.751,-3.45) 2(-2.251,-3.45) 3(-1.75,-3.45) 4(-1.25,-3.45) 5(-0.749,-3.45) 6(-0.249,-3.45) 7(0.249,-3.45) 8(0.75,-3.45) 9(1.25,-3.45) 10(1.75,-3.45) 11(2.251,-3.45) 12(2.751,-3.45) 25(2.751,3.449) 26(2.251,3.449) 27(1.75,3.449) 28(1.25,3.449) 29(0.75,3.449) 30(0.249,3.449) 31(-0.249,3.449) 32(-0.749,3.449) 33(-1.25,3.449) 34(-1.75,3.449) 35(-2.251,3.449) 36(-2.751,3.449)
  oval 0.9x0.28 smd: 13(3.45,-2.751) 14(3.45,-2.251) 15(3.45,-1.75) 16(3.45,-1.25) 17(3.45,-0.75) 18(3.45,-0.249) 19(3.45,0.249) 20(3.45,0.749) 21(3.45,1.25) 22(3.45,1.75) 23(3.45,2.251) 24(3.45,2.751) 37(-3.449,2.751) 38(-3.449,2.251) 39(-3.449,1.75) 40(-3.449,1.25) 41(-3.449,0.749) 42(-3.449,0.249) 43(-3.449,-0.249) 44(-3.449,-0.75) 45(-3.449,-1.25) 46(-3.449,-1.75) 47(-3.449,-2.251) 48(-3.449,-2.751)
  rect 5.5x5.5 smd: 49(0,0)
USB-C-SMD_USB-3.1TYPE-C16
  rect 0.77x1.05 smd: C1(-3.63,0) C2(-2.56,0) C11(2.56,0) C12(3.63,0)
  rect 0.31x1.05 smd: C3(-1.75,0) C4(-1.25,0) C5(-0.75,0) C6(-0.25,0) C7(0.25,0) C8(0.75,0) C9(1.25,0) C10(1.75,0)

## Nets
As in the schematic.

Pads without a net: J1 C3 C9; U1 2 3 4 12 13 15 18 21 26 27 31 38 42; U3 9 10 11; U4 4

## Via types
v1: diameter 0.6, hole 0.3, Top Layer to Bottom Layer, 114 vias

## Routing (per net, layer and track width the routed paths; a pad name or vN(x,y) marks a point on that pad's centre or on a via; arc(x,y) is an arc through that point)
+5V: length 24.2
  Top Layer w0.4: 42.04,36.56 44.45,34.15 v1(44.45,32.17) ; 42.04,36.56 40.91,36.56 ; 42.04,36.56 C10.2 ; 40.91,36.56 40.92,36.57 40.92,38.11 40.64,38.4 39.39,38.4 U4.3 39.33,42.16 T2.1 ; 40.91,36.56 U4.1 ; F1.2 46.23,29.2 v1(46.23,30.52)
  Bottom Layer w0.4: v1(46.23,30.52) 44.58,32.17 v1(44.45,32.17)
GND: length 131.2
  Top Layer w0.25: v1(22.61,17.57) 22.61,16.7 22.05,16.14 21.86,16.14 21.64,15.92 21.64,15.73 C7.1 ; v1(22.61,19.85) 22.33,20.13 C9.1 ; U3.7 U3.6 25.76,6.5 25.33,6.5 25.11,6.27 25.11,5.85 24.89,5.63 U3.3 U3.2 24.39,3.61 ; C11.1 15.94,25.86 15.94,25.67 16.07,25.55 16.07,24.93 ; C16.1 50.86,18.4 v1(48.64,16.17) ; v1(46.48,32.81) 46.48,33.07 R6.2 ; v1(33.81,27.32) 33.91,27.22 33.91,26.26 34.58,25.58 34.58,25.11 34.13,24.65 33.6,24.65 U1.35 33.49,24.54 33.09,24.54 32.85,24.3 32.85,23.9 31.33,22.37 32.38,21.32 U1.23 32.4,18.9 32.4,18.5 33.78,17.12 v1(33.78,13.38) 33.46,13.38 C6.1 31.68,14.33 v1(30.99,13.63) ; 44.89,6.18 45.51,6.18 46.23,6.9 v1(46.23,7.28) ; 27.96,26.63 27.96,25.91 27.88,25.82 27.96,25.74 27.96,25.34 28.2,25.1 28.6,25.1 30.13,23.57 U1.49 29.38,21.62 U1.8 ; C4.1 v1(36.3,13.25) ; X1.4 20.54,24.96 18.4,24.96 18.38,24.93 16.55,24.93 ; v1(35.18,29.51) 35.18,28.49 v1(34.8,28.11) ; v1(27.56,14.01) 27.56,15.3 C5.1 ; 16.55,24.93 16.07,24.93 ; 16.55,24.93 17.17,25.55 17.86,25.55 18.1,25.78 19.22,25.78 ; 16.07,24.93 v1(15.75,24.93) ; 16.07,24.93 16.07,24.26 C12.1 ; C18.1 24.2,2.16 24.2,2.35 24.39,2.54 24.39,3.61 ; C2.1 26.8,28.74 26.8,29.12 v1(27.18,29.51) ; v1(32.45,36.31) 32.45,35.85 C13.1 ; 24.39,3.61 23.26,3.61 v1(22.86,3.22) ; v1(46.86,16.3) 45.8,16.3 J2.13 ; v1(21.72,7.54) 21.51,7.54 20.89,6.92 20.89,6.73 C17.1 ; v1(33.65,37.51) 33.58,37.51 33.4,37.68 33.4,37.95 C1.1 ; v1(39.37,30.9) 39.37,30.12 39.2,29.95 39.2,29.19 39.36,29.02 39.6,29.02 U5.2 ; v1(47.37,5.76) 47.37,3.31 45.74,1.68 ; 27.96,26.63 v1(27.96,26.82) ; v1(36.96,21.38) 36.96,21.74 C3.1 ; v1(48.51,32.17) 49.88,32.17 49.89,32.16 50.43,32.16 50.45,32.17 51.36,32.17 J1.C1
  Bottom Layer w0.25: 35.42,27.42 34.94,27.42 34.84,27.32 v1(33.81,27.32) ; 35.42,27.42 37.55,25.28 37.55,23.57 37.85,23.28 37.85,22.27 v1(36.96,21.38) ; 35.42,27.42 35.42,27.49 v1(34.8,28.11) ; v1(33.65,37.51) v1(32.45,36.31) ; v1(22.61,17.57) v1(22.61,19.85) ; v1(35.18,29.51) 36.58,30.9 v1(39.37,30.9) ; v1(27.56,14.01) 27.94,13.63 v1(30.99,13.63) ; v1(22.86,3.22) 22.55,3.53 21.61,3.53 21.27,3.87 21.27,4.34 21.44,4.52 21.44,5.29 21.72,5.56 v1(21.72,7.54) ; v1(46.23,7.28) 46.23,6.9 v1(47.37,5.76) ; v1(48.51,32.17) 47.12,32.17 v1(46.48,32.81) ; v1(36.3,13.25) 33.91,13.25 v1(33.78,13.38) ; v1(15.75,24.93) 12.95,24.93 v1(10.67,22.65) ; v1(27.18,29.51) 27.43,29.25 27.43,29 27.96,28.47 v1(27.96,26.82) ; v1(46.86,16.3) 46.99,16.17 v1(48.64,16.17)
VBUS: length 33.3
  Top Layer w0.4: v1(51.18,30.01) 52.13,30.96 52.27,30.96 52.71,31.4 52.71,37.38 52.11,37.99 51.74,37.99 J1.C11 ; v1(46.48,27.22) 44.76,27.22 F1.1 44.12,26.59 v1(42.67,26.59) ; J1.C2 50.53,33.17 v1(50.17,32.81) ; U5.5 v1(36.83,28.62)
  Bottom Layer w0.4: v1(42.67,26.59) 40.64,28.62 v1(36.83,28.62) ; v1(46.48,27.22) 46.48,29.12 48.11,30.75 ; 48.11,30.75 48.84,30.01 v1(51.18,30.01) ; 48.11,30.75 v1(50.17,32.81)
+3,3V: length 231
  Top Layer w0.4: C14.1 7.22,36 ; 7.22,36 7.22,34.08 SW2.2 ; 7.22,36 7.24,35.98 8.13,35.98 9.2,37.06 U2.6 ; 35.64,36 35.64,35.91 R4.1 38.03,33.7 38.81,34.48 39.91,34.48 40.12,34.28 40.12,33.12 39.91,32.91 39.25,32.91 38.6,32.26 38.6,27.26 38.39,27.05 38.39,27.02 v1(38.13,26.75) ; 35.64,36 34.86,35.22 C13.2 ; 35.64,36 36.19,36.56 ; 40.51,6.08 R11.2 R10.2 39.12,9.19 v1(39.12,10.2) 40.01,11.1 R9.2 ; 40.51,6.08 40.89,6.46 ; 40.51,6.08 40.51,5.96 ; 40.27,19.46 R12.2 40.18,19.25 ; 40.27,19.46 40.26,19.47 ; 40.27,19.46 40.56,19.75 ; 40.27,19.46 37.21,16.4 ; U1.24 33.8,18 ; 33.8,18 33.83,18 ; 33.8,18 34.36,17.44 v1(34.36,16.43) ; v1(25.53,8.81) 25.39,8.67 U3.8 26.81,7.91 R15.1 27.94,6.02 U3.5 ; 26.68,25.12 25.62,26.19 v1(24.51,26.19) ; 26.68,25.12 27.38,25.82 ; 26.68,25.12 26.69,25.12 ; v1(27.94,12.49) 28.3,12.85 28.3,14.92 28.6,15.21 C5.2 28.96,16.15 v1(28.96,16.68) ; v1(30.86,9.19) 30.86,5.83 30.35,5.31 29.41,5.31 29.01,4.91 28.45,4.91 28.3,4.76 27.72,4.76 25.04,2.07 24.67,2.07 25.03,1.72 25.03,1.53 25,1.51 25,1.34 24.84,1.17 23.76,1.17 22.61,2.33 v1(20.7,2.33) ; 21.37,6.65 21.37,5.99 21.14,5.75 20.82,5.75 v1(20.7,5.63) ; v1(36.58,17.06) 37.21,16.43 37.21,16.4 ; v1(26.03,10.46) 26.03,14.1 25.35,14.79 25.15,14.79 24.94,14.99 24.94,15.19 L1.1 ; 22.58,28.74 18.66,32.67 17.04,32.67 R8.1 13.97,34.97 v1(13.21,35.73) ; 22.58,28.74 25.42,28.74 ; 22.58,28.74 22.33,28.49 v1(21.46,28.49) ; v1(13.21,37.69) 13.19,37.7 12.72,37.7 ; 37.21,16.4 C4.2 40.39,16.04 40.89,16.54 ; v1(39.62,19.98) 40.64,19.98 ; v1(34.01,25.34) 33.79,25.12 33.58,25.12 ; 12.72,37.7 13.99,38.97 13.99,39.99 14.19,40.2 15.29,40.2 16.07,39.41 R7.2 19.3,42.46 19.3,42.77 19.5,42.98 28.54,42.98 29.06,42.46 T1.1 35.18,39.22 C1.2 36.19,36.56 ; 12.72,37.7 U2.2 12.06,37.59 11.76,37.59 11.22,37.06 U2.6 ; C15.2 11.2,39.89 U2.8 9.78,38.24 10.09,38.24 10.4,37.93 10.4,37.48 10.09,37.17 9.78,37.17 U2.6 ; 36.19,36.56 U4.5 ; v1(37.08,4.74) 37.08,4.62 R14.2 ; C16.2 v1(47.62,19.22) ; v1(38.72,22.22) 38.11,21.61 v1(38.01,21.61) 36.68,22.93 35.97,22.93 v1(35.81,22.78) ; 44.89,8.38 44.44,8.83 44.09,8.83 43.89,9.03 43.89,9.38 42.3,10.96 v1(41.91,10.96)
  Bottom Layer w0.4: v1(13.21,35.73) v1(13.21,37.69) ; v1(20.7,2.33) v1(20.7,5.63) ; v1(37.08,4.74) 37.08,8.17 38.23,9.31 ; v1(38.72,22.22) 38.72,25.46 38.24,25.93 38.24,26.47 38.23,26.49 38.23,26.66 v1(38.13,26.75) ; v1(34.01,25.34) 35.81,23.54 v1(35.81,22.78) ; 27.92,10.46 v1(26.03,10.46) 26.03,9.31 v1(25.53,8.81) ; 27.92,10.46 27.94,10.47 v1(27.94,12.49) ; 27.92,10.46 29.59,10.46 v1(30.86,9.19) ; v1(41.91,10.96) 39.88,10.96 v1(39.12,10.2) 38.23,9.31 ; v1(28.96,16.68) 28.96,16.77 28.43,17.3 28.43,17.84 28.88,18.29 31.39,18.29 31.73,17.94 33.77,17.94 33.83,18 ; v1(24.51,26.19) 22.59,28.11 21.84,28.11 v1(21.46,28.49) ; v1(34.36,16.43) 34.99,17.06 v1(36.58,17.06) 38.23,15.41 38.23,15.06 38.24,15.04 38.24,14.5 38.23,14.49 38.23,9.31 ; v1(47.62,19.22) 40.39,19.22 v1(39.62,19.98) 38.01,21.6 v1(38.01,21.61)
  vias: v1(33.83,18.04)
+3,3VA: length 14.2
  Top Layer w0.4: v1(25.15,18.2) 25.57,17.78 L1.2 25.35,15.63 25.35,15.83 25.14,16.03 24.31,16.03 24.1,15.83 24.1,15.36 C8.2 22.48,15.3 C7.2 ; U1.9 25.53,21.12 v1(24.89,20.49)
  Bottom Layer w0.4: v1(24.89,20.49) 24.89,18.46 v1(25.15,18.2)
HSE_IN: length 12.3
  Top Layer w0.25: C11.2 17.69,25.95 18.4,26.66 20.54,26.66 X1.1 24.02,25.78 25.95,23.85 25.95,23.45 26.19,23.21 26.59,23.21 26.68,23.12
HSE_OUT: length 10.8
  Top Layer w0.25: U1.6 20.68,22.62 19.22,24.08 16.62,24.08 C12.2
I2C1_SCL: length 24.3
  Top Layer w0.25: U2.4 14.81,36.41 R8.2 17.78,34.97 v1(23.24,29.51) ; v1(28.87,27.83) 28.93,27.83 29.15,27.6 29.15,26.57 28.88,26.29 28.88,25.82
  Bottom Layer w0.25: v1(28.87,27.83) 28.87,28.01 28.76,28.12 28.76,29.96 28.45,30.27 24,30.27 v1(23.24,29.51)
I2C1_SDA: length 27.6
  Top Layer w0.25: v1(26.85,26.46) 26.85,26.53 27.74,27.42 28.31,27.42 28.5,27.22 28.56,27.22 28.67,27.11 28.67,26.65 28.46,26.44 28.46,25.91 28.38,25.82 ; U2.3 12.24,37.11 14.59,37.11 14.74,37.26 R7.1 24.52,29.63 26.08,29.63 v1(26.13,29.69)
  Bottom Layer w0.25: v1(26.85,26.46) 26.85,28.42 26.13,29.14 v1(26.13,29.69)
IMU_CS: length 21.9
  Top Layer w0.25: 26.96,8.68 26.2,9.44 23.47,9.44 23.47,7.4 23.5,7.38 U3.12 ; 26.96,8.68 v1(28.19,8.68) ; 26.96,8.68 26.98,8.69 26.98,15.46 27.88,16.36 U1.14 ; v1(29.84,8.42) 29.84,6.42 R15.2
  Bottom Layer w0.25: v1(29.84,8.42) 28.45,8.42 v1(28.19,8.68)
IMU_INT1: length 17.6
  Top Layer w0.25: U3.4 25.8,5.54 28.14,5.54 28.29,5.69 28.84,5.69 29,5.85 29,8.74 30.3,10.03 30.3,18.84 U1.19
NRST: length 45.4
  Top Layer w0.25: 9.65,23.28 11.05,23.28 v1(12.06,22.27) ; 9.65,23.28 v1(18.39,32.02) ; 9.65,23.28 SW1.2 ; v1(17.53,22.27) 20.47,22.27 20.52,22.22 21.85,22.22 22.79,21.27 22.79,21.08 C9.2 23.01,20.87 23.11,20.87 24.26,22.01 26.17,22.01 26.19,22.04 26.59,22.04 U1.7 ; J3.2 22.99,36.62 v1(20.83,34.46)
  Bottom Layer w0.25: v1(20.83,34.46) v1(18.39,32.02) ; v1(17.53,22.27) v1(12.06,22.27)
SD_CD: length 32.4
  Top Layer w0.25: v1(39.78,21.16) 38.1,19.47 v1(36.2,19.47) ; U1.25 33.6,19.6 v1(34.98,19.6) 35.05,19.53 35.05,8.16 R14.1 40.69,2.88 44.89,2.88
  Bottom Layer w0.25: v1(41.15,22.27) 40.04,21.16 v1(39.78,21.16) ; v1(34.98,19.6) 36.07,19.6 v1(36.2,19.47)
SDIO_CLK: length 21.5
  Top Layer w0.25: J2.5 44.37,7.8 44.12,7.8 41.22,10.7 41.22,11.62 40.91,11.93 36.81,11.93 35.56,13.18 35.56,19.84 34.28,21.12 U1.28
SDIO_CMD: length 20.7
  Top Layer w0.25: v1(37.59,14.77) 38.35,14.77 R9.1 41.76,12.61 43.96,10.41 43.96,10.17 44.12,10 44.37,10 J2.3 ; v1(29.08,17.57) 28.88,17.77 U1.16
  Bottom Layer w0.25: v1(37.59,14.77) 34.54,14.77 32.26,17.06 29.59,17.06 v1(29.08,17.57)
SDIO_D0: length 47.4
  Top Layer w0.25: R10.1 40.66,9.3 43.96,6.01 43.96,5.77 44.12,5.6 44.37,5.6 J2.7 45.41,5.6 45.65,5.6 47.62,7.57 47.62,18.14 44.89,20.87 44.89,21.7 v1(43.94,22.65) ; v1(42.65,21.35) 41.74,22.26 41.73,22.26 41.73,22.51 40.62,23.61 40.19,23.61 v1(37.59,26.2) ; 29.88,25.82 29.96,25.9 29.96,27.84 31.62,29.51 v1(32,29.51)
  Bottom Layer w0.25: v1(43.94,22.65) v1(42.65,21.35) ; v1(37.59,26.2) 34.86,28.93 34.86,28.98 34.53,29.32 34.48,29.32 34.29,29.51 v1(32,29.51)
SDIO_D1: length 33.1
  Top Layer w0.25: 42.69,4.62 R11.1 ; 42.69,4.62 44,4.62 44.12,4.5 44.37,4.5 J2.8 ; 42.69,4.62 42.67,4.64 v1(42.67,5.88) ; U1.29 35.9,21.62 36.72,20.8 38.36,20.8 v1(39.3,21.74) ; v1(43.81,14.39) 41.98,16.23 41.98,20.44 40.26,22.16 v1(40.26,23.03)
  Bottom Layer w0.25: v1(40.26,23.03) 40.26,22.7 v1(39.3,21.74) ; v1(43.81,14.39) 42.67,13.25 v1(42.67,5.88)
SDIO_D2: length 20.8
  Top Layer w0.25: U1.30 34.27,22.12 35.56,23.41 36.76,23.41 36.87,23.53 38.33,23.53 41.58,20.27 41.58,18.83 R12.1 40.49,17.62 41.4,16.71 41.4,15.17 44.89,11.68
SDIO_D3: length 35.4
  Top Layer w0.25: v1(39.52,23.44) 39.03,23.93 36.69,23.93 v1(36.58,24.05) ; v1(30.78,26.72) 30.78,26.48 30.96,26.31 30.96,25.91 30.88,25.82 ; R13.1 44.46,10.58 J2.2 45.41,11.1 45.65,11.1 45.82,11.27 45.82,14.59 44.76,15.65 44.76,17.07 44.89,17.2 44.89,20.3 v1(40.64,24.55)
  Bottom Layer w0.25: v1(30.78,26.72) 33.9,26.72 v1(36.58,24.05) ; v1(40.64,24.55) v1(39.52,23.44)
SPI1_MISO: length 47.6
  Top Layer w0.25: U3.1 23.58,4.82 19.99,4.82 19.81,5 19.81,18.97 15.11,23.66 15.11,25.95 16.31,27.14 25.52,27.14 25.92,27.54 26.73,27.54 28.25,29.06 29.53,29.06 29.59,29.11 29.59,29.15 ; 31.38,25.82 v1(31.38,28.24)
  Bottom Layer w0.25: v1(31.38,28.24) 30.47,29.15 29.59,29.15
  vias: v1(29.59,29.14)
SPI1_MOSI: length 15.9
  Top Layer w0.25: U3.14 23.92,6.02 24.17,6.26 24.17,6.3 v1(24.64,6.77) ; v1(29.72,15.79) 29.72,18.18 29.46,18.44 29.46,18.84 U1.17 ; v1(27.55,9.69) 28.96,11.09 v1(28.96,14.65)
  Bottom Layer w0.25: v1(24.64,6.77) v1(27.55,9.69) ; v1(29.72,15.79) 29.72,15.41 v1(28.96,14.65)
SPI1_SCK: length 55.8
  Top Layer w0.25: 31.88,25.82 31.96,25.91 31.96,26.31 32.13,26.48 v1(32.13,28.74) ; v1(22.35,5.63) 22.83,6.1 22.83,6.27 22.99,6.44 23.16,6.44 23.24,6.52 U3.13 ; v1(21.84,4.11) 21.16,3.42 18.21,3.42 18.03,3.6 18.03,17.95 13.46,22.52 13.46,26.33 14.67,27.54 25.34,27.54 25.85,28.05 26.67,28.05 28.51,29.89 v1(29.34,29.89)
  Bottom Layer w0.25: v1(22.35,5.63) 21.84,5.12 v1(21.84,4.11) ; v1(32.13,28.74) 31.95,28.93 31.77,28.93 30.81,29.89 v1(29.34,29.89)
SWCLK: length 20.2
  Top Layer w0.25: J3.3 29.1,38.25 31.07,38.25 arc(31.26,38.17) 31.35,37.97 31.35,36.01 32.4,34.95 32.4,30.62 32.88,30.15 32.88,25.82
SWDIO: length 23.6
  Top Layer w0.25: J3.4 31.24,38.65 31.35,38.65 31.75,38.25 31.75,38.14 33.27,36.62 v1(34.67,36.62) ; v1(35.81,34.08) 36.23,33.66 36.23,29.86 36.07,29.69 36.07,29.38 35.81,29.12 35.81,25.37 34.57,24.12 U1.34
  Bottom Layer w0.25: v1(35.81,34.08) 35.81,35.48 v1(34.67,36.62)
USB_DM: length 6.9
  Top Layer w0.25: 33.58,23.12 34.7,23.12 36.89,25.31 36.89,26.84 U5.6
USB_DM_C: length 19.8
  Top Layer w0.25: J1.C7 51.5,35.91 52.07,35.91 52.24,35.75 52.24,34.75 ; U5.1 42.1,27.67 45.87,31.44 52.07,31.44 52.24,31.6 52.24,34.75 ; 52.24,34.75 52.07,34.91 51.5,34.91 J1.C5
USB_DP: length 9
  Top Layer w0.25: U1.33 33.66,23.71 34.72,23.71 36.22,25.2 36.22,28.96 36.51,29.25 36.51,29.57 U5.4
USB_DP_C: length 16.2
  Top Layer w0.25: J1.C8 51.37,36.41 50.8,36.41 50.63,36.25 50.63,35.71 50.8,35.55 51.3,35.55 51.34,35.51 51.4,35.51 J1.C6 51.37,35.41 50.8,35.41 47.22,31.84 45.71,31.84 43.43,29.57 U5.3
$1N12: length 4.3
  Top Layer w0.25: C6.2 33.08,16.87 31.96,17.99 31.96,18.84 U1.22
$1N43: length 36.3
  Top Layer w0.25: v1(26.03,26.84) 26.34,27.14 26.9,27.14 28.38,28.62 29.29,28.62 29.57,28.34 v1(29.57,28.27) 29.56,28.26 29.56,26.4 29.38,26.22 29.38,25.82 ; SW2.1 v1(14.61,29.25) ; v1(34.29,28.74) 34.29,29.5 35.55,30.77 R1.2
  Bottom Layer w0.25: v1(14.61,29.25) 22.68,29.25 23,28.93 23.95,28.93 v1(26.03,26.84) ; v1(34.29,28.74) 33.2,27.66 30.18,27.66 v1(29.57,28.27)
$1N49: length 23
  Top Layer w0.25: v1(31.11,17.64) 30.88,17.88 U1.20 ; v1(31.75,30.39) 31.62,30.39 R2.2 ; v1(35.18,26.84) 33.53,28.49 v1(33.53,30.14)
  Bottom Layer w0.25: v1(31.11,17.64) 31.29,17.46 34.41,17.46 34.41,19.84 37.15,22.59 37.15,24.28 35.18,26.26 v1(35.18,26.84) ; v1(31.75,30.39) 33.35,30.39 33.53,30.21 v1(33.53,30.14)
$1N78: length 21.1
  Top Layer w0.25: U1.11 26.59,20.04 26.09,20.04 24.26,18.2 v1(20.45,18.2) ; v1(17.14,16.93) 17.14,8.67 R3.1
  Bottom Layer w0.25: v1(17.14,16.93) 18.42,18.2 v1(20.45,18.2)
$1N80: length 21.3
  Top Layer w0.25: SW3.1 14.86,16.3 v1(16.64,18.08) ; U1.10 26.04,20.62 24.64,19.22 v1(20.45,19.22)
  Bottom Layer w0.25: v1(16.64,18.08) 17.78,19.22 v1(20.45,19.22)
$1N256: length 5.2
  Top Layer w0.25: D1.2 14.1,7.41 14.93,6.57 16.27,6.57 16.98,7.28 R3.2
$1N258: length 12.6
  Top Layer w0.25: D2.2 30.94,36.1 30.94,35.84 31.62,35.16 v1(31.62,33.32) ; v1(37.08,32.68) 38.35,32.68 R4.2
  Bottom Layer w0.25: v1(37.08,32.68) 32.26,32.68 v1(31.62,33.32)
$1N260: length 4.4
  Top Layer w0.25: R5.1 48.77,36.36 49.08,36.68 50.06,36.68 50.8,37.41 51.37,37.41 J1.C10
$1N261: length 5.2
  Top Layer w0.25: v1(49.91,33.57) 49.95,33.57 50.8,34.41 51.37,34.41 J1.C4 ; R6.1 48.53,34.61 v1(48.87,34.61)
  Bottom Layer w0.25: v1(49.91,33.57) v1(48.87,34.61)

## Copper pours and planes (outline as drawn; the poured copper is in the pictures)
GND on Top Layer: -0.76,45.76 61.34,45.76 61.34,-0.85 -0.76,-0.85
GND on Bottom Layer: -0.89,45.76 60.96,45.76 60.96,-0.72 -0.89,-0.72
